# Altium schematic sheet MCU.SchDoc
size A4; SheetNumber: 2; SheetTotal: 4
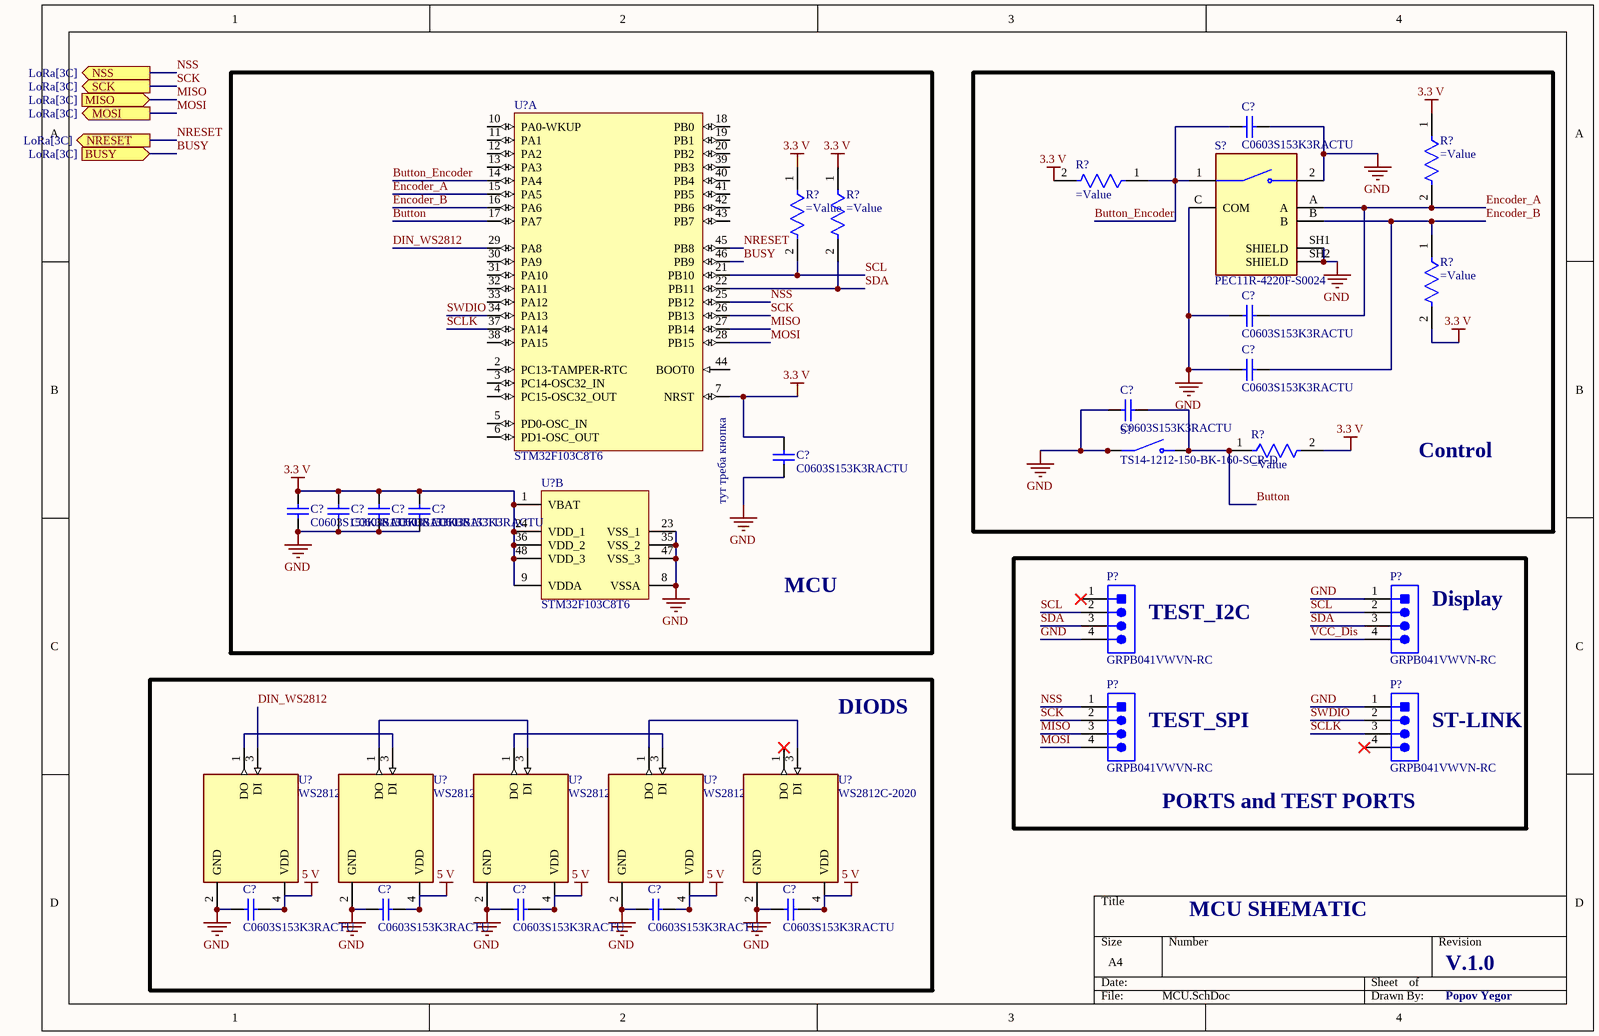
[diagram p0: MCU.SchDoc]

## Parts
(Parts that share a designator on the sheet are numbered #1, #2 ... from top to bottom, then left to right.)
C?#1  C0603S153K3RACTU  [CAP_0603]
C?#2  C0603S153K3RACTU  [CAP_0603]
C?#3  C0603S153K3RACTU  [CAP_0603]
C?#4  C0603S153K3RACTU  [CAP_0603]
C?#5  C0603S153K3RACTU  [CAP_0603]
C?#6  C0603S153K3RACTU  [CAP_0603]
C?#7  C0603S153K3RACTU  [CAP_0603]
C?#8  C0603S153K3RACTU  [CAP_0603]
C?#9  C0603S153K3RACTU  [CAP_0603]
C?#10  C0603S153K3RACTU  [CAP_0603]
C?#11  C0603S153K3RACTU  [CAP_0603]
C?#12  C0603S153K3RACTU  [CAP_0603]
C?#13  C0603S153K3RACTU  [CAP_0603]
C?#14  C0603S153K3RACTU  [CAP_0603]
P?#1  GRPB041VWVN-RC  [SLIN-GRPB041VWVN-RC_V]
P?#2  GRPB041VWVN-RC  [SLIN-GRPB041VWVN-RC_V]
P?#3  GRPB041VWVN-RC  [SLIN-GRPB041VWVN-RC_V]
P?#4  GRPB041VWVN-RC  [SLIN-GRPB041VWVN-RC_V]
R?#1  (no value)  [Res_0603]
R?#2  (no value)  [Res_0603]
R?#3  (no value)  [Res_0603]
R?#4  (no value)  [Res_0603]
R?#5  (no value)  [Res_0603]
R?#6  (no value)  [Res_0603]
S?#1  PEC11R-4220F-S0024  [XDCR_PEC11R-4220F-S0024]
S?#2  TS14-1212-150-BK-160-SCR-D  [SW_TS14-1212-150-BK-160-SCR-D]
U?#1  STM32F103C8T6  [STM-LQFP48_L]  (part A of 2)
U?#2  STM32F103C8T6  [STM-LQFP48_L]  (part B of 2)
U?#3  WS2812C-2020  [LED_WS2812C-2020]
U?#4  WS2812C-2020  [LED_WS2812C-2020]
U?#5  WS2812C-2020  [LED_WS2812C-2020]
U?#6  WS2812C-2020  [LED_WS2812C-2020]
U?#7  WS2812C-2020  [LED_WS2812C-2020]

## Blocks framed on the sheet
MCU: C?#5-C?#9 R?#2 R?#3 U?#1 U?#2
Control: C?#1-C?#4 R?#1 R?#4-R?#6 S?#1 S?#2
DIODS: C?#10-C?#14 U?#3-U?#7

## Ports
BUSY (in, see LoRa[3C]), MISO (in, see LoRa[3C]), MOSI (out, see LoRa[3C]), NRESET (out, see LoRa[3C]), NSS (out, see LoRa[3C]), SCK (out, see LoRa[3C])

## Nets
3.3 V: C?#5.1 C?#6.1 C?#7.1 C?#8.1 C?#9.1 R?#1.1 R?#2.1 R?#3.1 R?#4.2 R?#5.2 R?#6.2 U?#1.7(NRST) U?#2.1(VBAT) U?#2.9(VDDA) U?#2.24(VDD_1) U?#2.36(VDD_2) U?#2.48(VDD_3)
5 V: C?#10.2 C?#11.2 C?#12.2 C?#13.2 C?#14.2 U?#3.4(VDD) U?#4.4(VDD) U?#5.4(VDD) U?#6.4(VDD) U?#7.4(VDD)
GND: C?#1.1 C?#2.2 C?#3.2 C?#4.1 C?#5.2 C?#6.2 C?#7.2 C?#8.2 C?#9.2 C?#10.1 C?#11.1 C?#12.1 C?#13.1 C?#14.1 P?#1.4 P?#2.1 P?#4.1 S?#1.2 S?#1.C(COM) S?#1.SH1(SHIELD) S?#1.SH2(SHIELD) S?#2.3(COM) S?#2.4(COM) U?#2.8(VSSA) U?#2.23(VSS_1) U?#2.35(VSS_2) U?#2.47(VSS_3) U?#3.2(GND) U?#4.2(GND) U?#5.2(GND) U?#6.2(GND) U?#7.2(GND)
BUSY: U?#1.46(PB9) ; port BUSY
Button: C?#4.2 R?#6.1 S?#2.1(NO) S?#2.2(NO) U?#1.17(PA7)
Button_Encoder: C?#1.2 R?#4.1 S?#1.1 U?#1.14(PA4)
DIN_WS2812: U?#1.29(PA8) U?#3.3(DI)
Encoder_A: C?#2.1 R?#1.2 S?#1.A U?#1.15(PA5)
Encoder_B: C?#3.1 R?#5.1 S?#1.B U?#1.16(PA6)
MISO: P?#3.3 U?#1.27(PB14) ; port MISO
MOSI: P?#3.4 U?#1.28(PB15) ; port MOSI
NRESET: U?#1.45(PB8) ; port NRESET
NSS: P?#3.1 U?#1.25(PB12) ; port NSS
SCK: P?#3.2 U?#1.26(PB13) ; port SCK
SCL: P?#1.2 P?#2.2 R?#2.2 U?#1.21(PB10)
SCLK: P?#4.3 U?#1.37(PA14)
SDA: P?#1.3 P?#2.3 R?#3.2 U?#1.22(PB11)
SWDIO: P?#4.2 U?#1.34(PA13)
VCC_Dis: P?#2.4
NetU?#3_1: U?#3.1(DO) U?#4.3(DI)
NetU?#4_1: U?#4.1(DO) U?#5.3(DI)
NetU?#5_1: U?#5.1(DO) U?#6.3(DI)
NetU?#6_1: U?#6.1(DO) U?#7.3(DI)

Not connected (* = marked no-connect by the designer): P?#1 1*; P?#4 4*; U?#1 2(PC13-TAMPER-RTC) 3(PC14-OSC32_IN) 4(PC15-OSC32_OUT) 5(PD0-OSC_IN) 6(PD1-OSC_OUT) 10(PA0-WKUP) 11(PA1) 12(PA2) 13(PA3) 18(PB0) 19(PB1) 20(PB2) 30(PA9) 31(PA10) 32(PA11) 33(PA12) 38(PA15) 39(PB3) 40(PB4) 41(PB5) 42(PB6) 43(PB7) 44(BOOT0); U?#7 1(DO)*

## Notes on the sheet
- (near U?#1) тут треба кнопка
- (near P?#1) TEST_I2C
- (near P?#2) Display
- (near P?#3) TEST_SPI
- (near P?#4) ST-LINK
- (near P?#4) PORTS and TEST PORTS
- MCU SHEMATIC
- V.1.0
- Popov Yegor

## Library data of the parts
C?#1-C?#14 = CAP_0603: Manufacturer: Kemet; Part Number: C0603S153K3RACTU
P?#1-P?#4 = CMP-2000-06373-1: Male Header, Pitch 1.27 mm, 1 x 4 Position, Height 4 mm, Tail Length 2.3 mm, -40 to 105 degC, RoHS, Bulk; Manufacturer: Sullins; Mating Products: S9010E-04-ND / -CONNHEADER.050"4POSR/APCB / S9008E-04-ND / -CONNHEADER.050"4POSPCBGOLD / S9005E-04-ND / -CONNHEADER.050"4POSSMDGOLD; Other Names: S9014E-04; Dynamic Catalog: GRPB; Pitch: 0.050"(1.27mm); Number of Positions Loaded: All; Number of Positions: 4; Catalog Drawings: S9014ESeriesTop; Connector Type: Header,Unshrouded; Contact Finish Thickness: Flash; Number of Rows: 1; Contact Type: MalePin; Category: Connectors,Interconnects; Contact Mating Length: 0.118"(3.00mm); Family: RectangularConnectors-Headers,MalePins; Datasheet Version: Rev. C, 12/2008; Contact Finish: Gold; Termination: Solder; Manufacturer URL: http://www.sullinscorp.com/; Mounting Type: ThroughHole; Packaging: Bulk; Package Reference: GRPB041VWVN-RC; Datasheet URL: http://www.sullinscorp.com/drawings/71_GRPB___1VWVN-RC,_10957-C.pdf; Mounting Technology: ThroughHole; Package Description: Male Header, Pitch 1.27 mm, 1 x 4 Position, Height 4 mm, Tail Length 2.3 mm; Standard Package: 1
R?#1-R?#6 = R_0603: 1.54kΩ ±1% 0.1W 0603 Thick Film Chip Resistor AEC-Q200 compliant; Resistance: 1.54kR; Temperature Coefficient: 200ppm/°C; Max Operating Temperature: 155°C; Radiation Hardening: No; Packaging: Tape and Reel; Case/Package: 0603; Min Operating Temperature: -55°C; Mount: Surface Mount; Resistor Type: Thick Film; Tolerance: 1%; RoHS Compliant: Yes
S?#1 = PEC11R-4220F-S0024: MF: {'manufacturer': u'Bourns Inc.'}; Package: None; Price: None; Value: *; MP: PEC11R-4220F-S0024; Availability: Unavailable
S?#2 = TS14-1212-150-BK-160-SCR-D: 12 x 12 mm, 15 mm Actuator Height, 160 gf, Short Crimped, Black, Through Hole, SPST, Tactile Switch; MF: Same Sky; SnapEDA_Link: https://www.snapeda.com/parts/TS14-1212-150-BK-160-SCR-D/Same+Sky/view-part/?ref=snap; Package: None; Value: *; MP: TS14-1212-150-BK-160-SCR-D; Check_prices: https://www.snapeda.com/parts/TS14-1212-150-BK-160-SCR-D/Same+Sky/view-part/?ref=eda
U?#1 U?#2 = CMP-0237-00215-3: ARM Cortex-M3 32-bit MCU, 64 KB Flash, 20 KB Internal RAM, 37 I/Os, 48-pin LQFP, -40 to 85 degC, Tray; Supply Voltage(Vcc) min (V): 2; Internal RAM Size (kB): 20; FLASH Size (Prog) (kB): 64; A/D Converter: 2x12-bit (10 Channel); I/Os (High Current): 37; Operating Frequency(F) (Processor speed) (MHz): 72; Core: ARM Cortex-M3; ComponentLink3Description: Package Specification; Mounting Technology: Surface Mount; PartNumber: STM32F103C8T6; PackageReference: LQFP48; Packing: Tray; ComponentLink3URL: http://www.st.com/st-web-ui/static/active/en/resource/technical/document/datasheet/DM00058181.pdf; DatasheetVersion: Rev. 16; ComponentLink1URL: http://www.st.com/web/en/home.html; PackageVersion: Rev. 6, 06/2013; ComponentLink2URL: http://www.st.com/st-web-ui/static/active/en/resource/technical/document/datasheet/CD00161566.pdf; ComponentLink1Description: Manufacturer URL; ComponentLink2Description: Datasheet; PackageDescription: 48-Pin Low Profile Quad Flat Package, 7 x 7 mm Body, 0.5 mm Pitch
U?#3-U?#7 = WS2812C-2020: Intelligent control LED integrated light source; MF: Worldsemi; SnapEDA_Link: https://www.snapeda.com/parts/WS2812C-2020/Worldsemi/view-part/?ref=snap; Package: Package; Value: *; MP: WS2812C-2020; Check_prices: https://www.snapeda.com/parts/WS2812C-2020/Worldsemi/view-part/?ref=eda